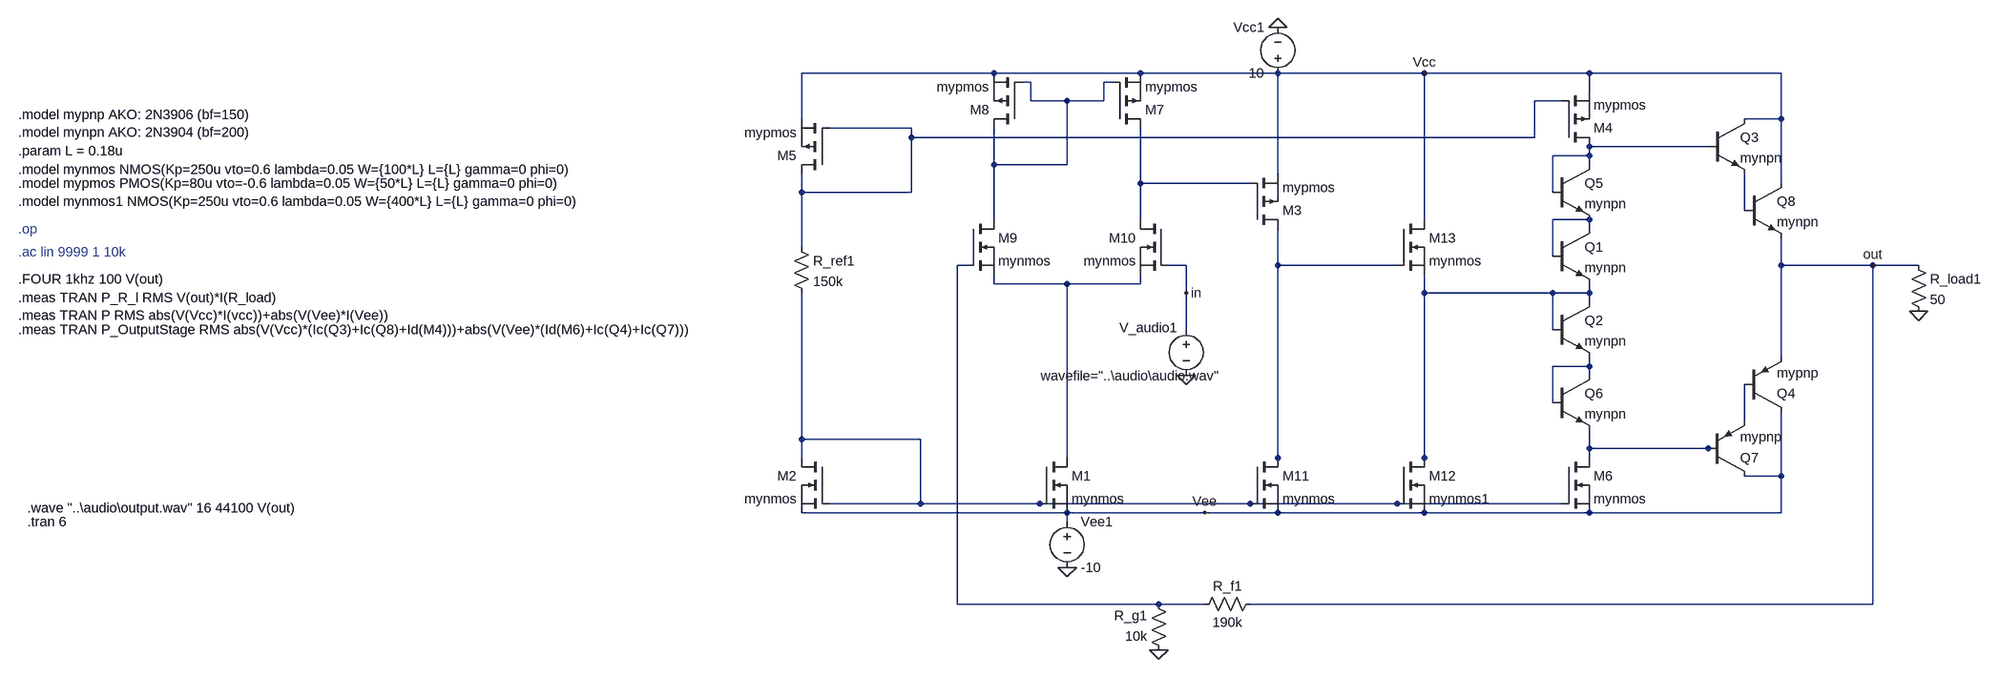
[diagram p0: schematic audio_test.asc]
audio_test.asc, the LTspice schematic file:
Version 4.1
SHEET 1 2212 852
WIRE 272 -176 -64 -176
WIRE 528 -176 272 -176
WIRE 768 -176 528 -176
WIRE 1024 -176 768 -176
WIRE 1312 -176 1024 -176
WIRE 1664 -176 1312 -176
WIRE 336 -160 320 -160
WIRE 480 -160 464 -160
WIRE 1312 -144 1312 -176
WIRE 336 -128 336 -160
WIRE 400 -128 336 -128
WIRE 464 -128 464 -160
WIRE 464 -128 400 -128
WIRE 1264 -128 1216 -128
WIRE -64 -96 -64 -176
WIRE 1664 -96 1664 -176
WIRE 1664 -96 1600 -96
WIRE 128 -80 -16 -80
WIRE 128 -64 128 -80
WIRE 1216 -64 1216 -128
WIRE 1216 -64 128 -64
WIRE 1312 -48 1312 -64
WIRE 1536 -48 1312 -48
WIRE 1312 -32 1312 -48
WIRE 1312 -32 1248 -32
WIRE 272 -16 272 -80
WIRE 400 -16 400 -128
WIRE 400 -16 272 -16
WIRE 1312 -16 1312 -32
WIRE 768 0 768 -176
WIRE 528 16 528 -80
WIRE 720 16 528 16
WIRE 1664 16 1664 -96
WIRE -64 32 -64 0
WIRE 128 32 128 -64
WIRE 128 32 -64 32
WIRE 1248 32 1248 -32
WIRE 1600 64 1600 0
WIRE 272 80 272 -16
WIRE 528 80 528 16
WIRE 1024 80 1024 -176
WIRE 1312 80 1248 80
WIRE 1312 96 1312 80
WIRE -64 128 -64 32
WIRE 1248 144 1248 80
WIRE 224 160 208 160
WIRE 608 160 576 160
WIRE 768 160 768 96
WIRE 976 160 768 160
WIRE 1664 160 1664 112
WIRE 1824 160 1664 160
WIRE 1904 160 1824 160
WIRE 272 192 272 176
WIRE 400 192 272 192
WIRE 528 192 528 176
WIRE 528 192 400 192
WIRE 608 208 608 160
WIRE 1024 208 1024 176
WIRE 1248 208 1024 208
WIRE 1312 208 1312 192
WIRE 1312 208 1248 208
WIRE 1312 224 1312 208
WIRE 608 272 608 208
WIRE 1248 272 1248 208
WIRE 1664 320 1664 160
WIRE 1312 336 1312 320
WIRE 1312 336 1248 336
WIRE 1312 352 1312 336
WIRE 1248 400 1248 336
WIRE 1600 432 1600 368
WIRE -64 464 -64 208
WIRE 144 464 -64 464
WIRE 1312 480 1312 448
WIRE 1536 480 1312 480
WIRE 1552 480 1536 480
WIRE -64 496 -64 464
WIRE 400 496 400 192
WIRE 768 496 768 160
WIRE 1024 496 1024 208
WIRE 1312 496 1312 480
WIRE 768 512 768 496
WIRE 1024 512 1024 496
WIRE 1664 528 1664 416
WIRE 1664 528 1600 528
WIRE 144 576 144 464
WIRE 144 576 -16 576
WIRE 352 576 144 576
WIRE 720 576 352 576
WIRE 976 576 720 576
WIRE 1264 576 976 576
WIRE 400 592 -64 592
WIRE 640 592 400 592
WIRE 768 592 640 592
WIRE 1024 592 768 592
WIRE 1312 592 1312 576
WIRE 1312 592 1024 592
WIRE 1664 592 1664 528
WIRE 1664 592 1312 592
WIRE 400 608 400 592
WIRE 208 752 208 160
WIRE 560 752 208 752
WIRE 640 752 560 752
WIRE 1824 752 1824 160
WIRE 1824 752 720 752
FLAG 400 688 0
FLAG 608 352 0
FLAG 608 208 in
FLAG 1904 240 0
FLAG 560 832 0
FLAG 1824 160 out
FLAG 768 -256 0
FLAG 640 592 Vee
FLAG 1024 -176 Vcc
DATAFLAG 400 192 ""
DATAFLAG 144 576 ""
DATAFLAG -64 464 ""
SYMBOL voltage 400 592 R0
SYMATTR InstName Vee1
SYMATTR Value -10
SYMBOL res -80 112 R0
SYMATTR InstName R_ref1
SYMATTR Value 150k
SYMBOL nmos 352 496 R0
SYMATTR InstName M1
SYMATTR Value mynmos
SYMBOL nmos -16 496 M0
SYMATTR InstName M2
SYMATTR Value mynmos
SYMBOL npn 1248 96 R0
SYMATTR InstName Q1
SYMATTR Value mynpn
SYMBOL npn 1248 224 R0
SYMATTR InstName Q2
SYMATTR Value mynpn
SYMBOL npn 1536 -96 R0
SYMATTR InstName Q3
SYMATTR Value mynpn
SYMBOL pnp 1600 416 M180
SYMATTR InstName Q4
SYMATTR Value mypnp
SYMBOL res 1888 144 R0
SYMATTR InstName R_load1
SYMATTR Value 50
SYMBOL pmos 720 96 M180
SYMATTR InstName M3
SYMATTR Value mypmos
SYMBOL pmos 1264 -48 M180
SYMATTR InstName M4
SYMATTR Value mypmos
SYMBOL pmos -16 0 R180
SYMATTR InstName M5
SYMATTR Value mypmos
SYMBOL nmos 1264 496 R0
SYMATTR InstName M6
SYMATTR Value mynmos
SYMBOL pmos 480 -80 M180
SYMATTR InstName M7
SYMATTR Value mypmos
SYMBOL pmos 320 -80 R180
SYMATTR InstName M8
SYMATTR Value mypmos
SYMBOL nmos 224 80 R0
SYMATTR InstName M9
SYMATTR Value mynmos
SYMBOL nmos 576 80 M0
SYMATTR InstName M10
SYMATTR Value mynmos
SYMBOL npn 1248 -16 R0
SYMATTR InstName Q5
SYMATTR Value mynpn
SYMBOL npn 1248 352 R0
SYMATTR InstName Q6
SYMATTR Value mynpn
SYMBOL pnp 1536 528 M180
SYMATTR InstName Q7
SYMATTR Value mypnp
SYMBOL npn 1600 16 R0
SYMATTR InstName Q8
SYMATTR Value mynpn
SYMBOL res 736 736 R90
WINDOW 0 0 56 VBottom 2
WINDOW 3 32 56 VTop 2
SYMATTR InstName R_f1
SYMATTR Value 190k
SYMBOL res 576 848 R180
WINDOW 0 36 76 Left 2
WINDOW 3 36 40 Left 2
SYMATTR InstName R_g1
SYMATTR Value 10k
SYMBOL nmos 720 496 R0
SYMATTR InstName M11
SYMATTR Value mynmos
SYMBOL nmos 976 496 R0
SYMATTR InstName M12
SYMATTR Value mynmos1
SYMBOL nmos 976 80 R0
SYMATTR InstName M13
SYMATTR Value mynmos
SYMBOL voltage 768 -160 R180
WINDOW 0 24 96 Left 2
WINDOW 3 24 16 Left 2
SYMATTR InstName Vcc1
SYMATTR Value 10
SYMBOL voltage 608 256 R0
WINDOW 123 -254 97 Left 2
WINDOW 39 0 0 Left 0
WINDOW 3 -203 98 Left 2
WINDOW 0 -117 13 Left 2
SYMATTR Value2 wavefile="..\audio\audio.wav"
SYMATTR Value ""
SYMATTR InstName V_audio1
TEXT -1432 -40 Left 2 !.param L = 0.18u
TEXT -1432 -8 Left 2 !.model mynmos NMOS(Kp=250u vto=0.6 lambda=0.05 W={100*L} L={L} gamma=0 phi=0)
TEXT -1432 16 Left 2 !.model mypmos PMOS(Kp=80u vto=-0.6 lambda=0.05 W={50*L} L={L} gamma=0 phi=0)
TEXT -1432 -104 Left 2 !.model mypnp AKO: 2N3906 (bf=150)\n.model mynpn AKO: 2N3904 (bf=200)
TEXT -1432 48 Left 2 !.model mynmos1 NMOS(Kp=250u vto=0.6 lambda=0.05 W={400*L} L={L} gamma=0 phi=0)
TEXT -1432 96 Left 2 ;.op
TEXT -1432 216 Left 2 !.meas TRAN P_R_l RMS V(out)*I(R_load)\n.meas TRAN P RMS abs(V(Vcc)*I(vcc))+abs(V(Vee)*I(Vee))
TEXT -1432 136 Left 2 ;.ac lin 9999 1 10k
TEXT -1432 184 Left 2 !.FOUR 1khz 100 V(out)
TEXT -1432 272 Left 2 !.meas TRAN P_OutputStage RMS abs(V(Vcc)*(Ic(Q3)+Ic(Q8)+Id(M4)))+abs(V(Vee)*(Id(M6)+Ic(Q4)+Ic(Q7)))
TEXT -1416 584 Left 2 !.wave "..\audio\output.wav" 16 44100 V(out)
TEXT -1416 608 Left 2 !.tran 6

The netlist it stands for:
* audio_test.asc
Vee1 Vee 0 -10
R_ref1 N002 N013 150k
M1 N009 N013 Vee Vee mynmos
M2 N013 N013 Vee Vee mynmos
Q1 N006 N006 N010 0 mynpn
Q2 N010 N010 N011 0 mynpn
Q3 Vcc N003 N005 0 mynpn
Q4 Vee N012 out 0 mypnp
R_load1 out 0 50
M3 N008 N004 Vcc Vcc mypmos
M4 N003 N002 Vcc Vcc mypmos
M5 N002 N002 Vcc Vcc mypmos
M6 N014 N013 Vee Vee mynmos
M7 N004 N001 Vcc Vcc mypmos
M8 N001 N001 Vcc Vcc mypmos
M9 N001 N007 N009 N009 mynmos
M10 N004 in N009 N009 mynmos
Q5 N003 N003 N006 0 mynpn
Q6 N011 N011 N014 0 mynpn
Q7 Vee N014 N012 0 mypnp
Q8 Vcc N005 out 0 mynpn
R_f1 out N007 190k
R_g1 0 N007 10k
M11 N008 N013 Vee Vee mynmos
M12 N010 N013 Vee Vee mynmos1
M13 Vcc N008 N010 N010 mynmos
Vcc1 Vcc 0 10
V_audio1 in 0 wavefile="..\audio\audio.wav"
.model NPN NPN
.model PNP PNP
.lib standard.bjt
.model NMOS NMOS
.model PMOS PMOS
.lib standard.mos
.param L = 0.18u
.model mynmos NMOS(Kp=250u vto=0.6 lambda=0.05 W={100*L} L={L} gamma=0 phi=0)
.model mypmos PMOS(Kp=80u vto=-0.6 lambda=0.05 W={50*L} L={L} gamma=0 phi=0)
.model mypnp AKO: 2N3906 (bf=150)
.model mynpn AKO: 2N3904 (bf=200)
.model mynmos1 NMOS(Kp=250u vto=0.6 lambda=0.05 W={400*L} L={L} gamma=0 phi=0)
* .op
.meas TRAN P_R_l RMS V(out)*I(R_load)
.meas TRAN P RMS abs(V(Vcc)*I(vcc))+abs(V(Vee)*I(Vee))
* .ac lin 9999 1 10k
.FOUR 1khz 100 V(out)
.meas TRAN P_OutputStage RMS abs(V(Vcc)*(Ic(Q3)+Ic(Q8)+Id(M4)))+abs(V(Vee)*(Id(M6)+Ic(Q4)+Ic(Q7)))
.wave "..\audio\output.wav" 16 44100 V(out)
.tran 6
.backanno
.end